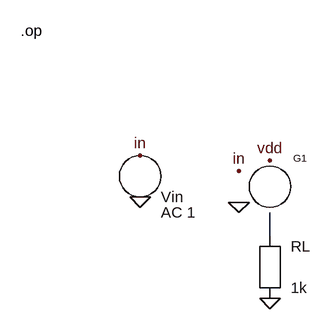
[diagram p0: schematic vccs_stage_labelled.asc]
vccs_stage_labelled.asc, the LTspice schematic file:
Version 4
SHEET 1 880 680
WIRE 400 296 400 332
FLAG 400 216 vdd
FLAG 400 428 0
FLAG 352 232 in
FLAG 352 280 0
FLAG 200 208 in
FLAG 200 272 0
SYMBOL g 400 200 R0
SYMATTR InstName G1
SYMATTR Value 1m
SYMBOL res 400 380 R0
SYMATTR InstName RL
SYMATTR Value 1k
SYMBOL voltage 200 240 R0
SYMATTR InstName Vin
SYMATTR Value AC 1
TEXT 16 16 Left 2 !.op

The netlist it stands for:
* vccs_stage_labelled.asc
G1 N001 vdd in 0 1m
RL N001 0 1k
Vin in 0 AC 1
.op
.backanno
.end